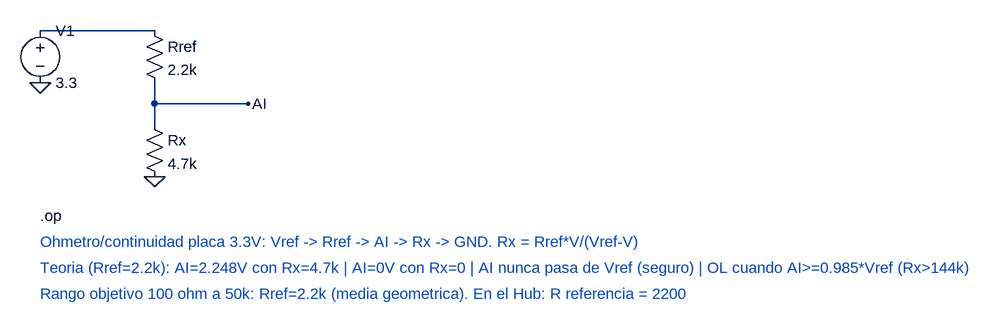
[diagram p0: schematic ohmetro.asc]
ohmetro.asc, the LTspice schematic file:
Version 4
SHEET 1 880 680
WIRE 0 16 176 16
WIRE 176 96 176 128
WIRE 176 128 176 160
WIRE 176 128 320 128
FLAG 0 96 0
FLAG 320 128 AI
FLAG 176 240 0
SYMBOL voltage 0 0 R0
SYMATTR InstName V1
SYMATTR Value 3.3
SYMBOL res 160 0 R0
SYMATTR InstName Rref
SYMATTR Value 2.2k
SYMBOL res 160 144 R0
SYMATTR InstName Rx
SYMATTR Value 4.7k
TEXT 0 300 Left 2 !.op
TEXT 0 340 Left 2 ;Ohmetro/continuidad placa 3.3V: Vref -> Rref -> AI -> Rx -> GND. Rx = Rref*V/(Vref-V)
TEXT 0 380 Left 2 ;Teoria (Rref=2.2k): AI=2.248V con Rx=4.7k | AI=0V con Rx=0 | AI nunca pasa de Vref (seguro) | OL cuando AI>=0.985*Vref (Rx>144k)
TEXT 0 420 Left 2 ;Rango objetivo 100 ohm a 50k: Rref=2.2k (media geometrica). En el Hub: R referencia = 2200

The netlist it stands for:
* ohmetro.asc
V1 N001 0 3.3
Rref N001 AI 2.2k
Rx AI 0 4.7k
.op
* Ohmetro/continuidad placa 3.3V: Vref -> Rref -> AI -> Rx -> GND. Rx = Rref*V/(Vref-V)
* Teoria (Rref=2.2k): AI=2.248V con Rx=4.7k | AI=0V con Rx=0 | AI nunca pasa de Vref (seguro) | OL cuando AI>=0.985*Vref (Rx>144k)
* Rango objetivo 100 ohm a 50k: Rref=2.2k (media geometrica). En el Hub: R referencia = 2200
.backanno
.end